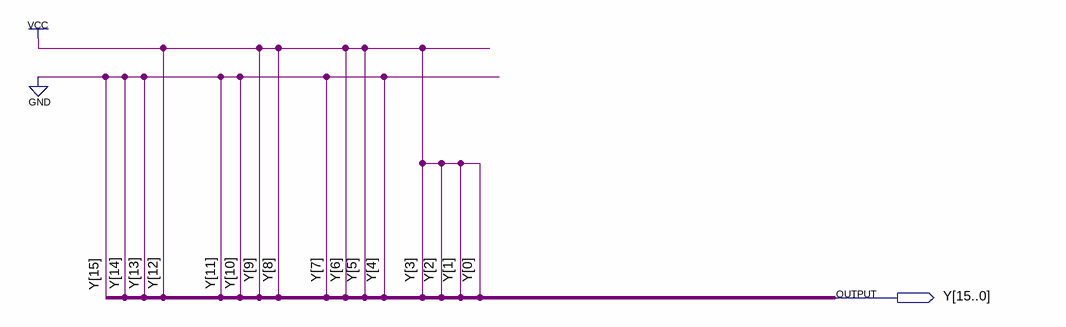
[diagram p0: schematic sheet]
// Quartus schematic K_const.bdf as structural Verilog: 0 symbols, 1 pins
module K_const (
  output [15:0] Y
);


  assign Y = 16'b0001001101101111;
endmodule
